# EasyEDA Pro project V3ProPrj_ROV板子_2026-09-12.epro

# Schematic Schematic1
Assembly Variant: Basic; Board Name: Board1; Create Date: 2026-09-11; Page Name: P1; Project Name: ROV板子; Schematic Name: Schematic1; Update Date: 2026-09-11; Company: 嘉立创EDA; Page Size: A4; Version: V1.0
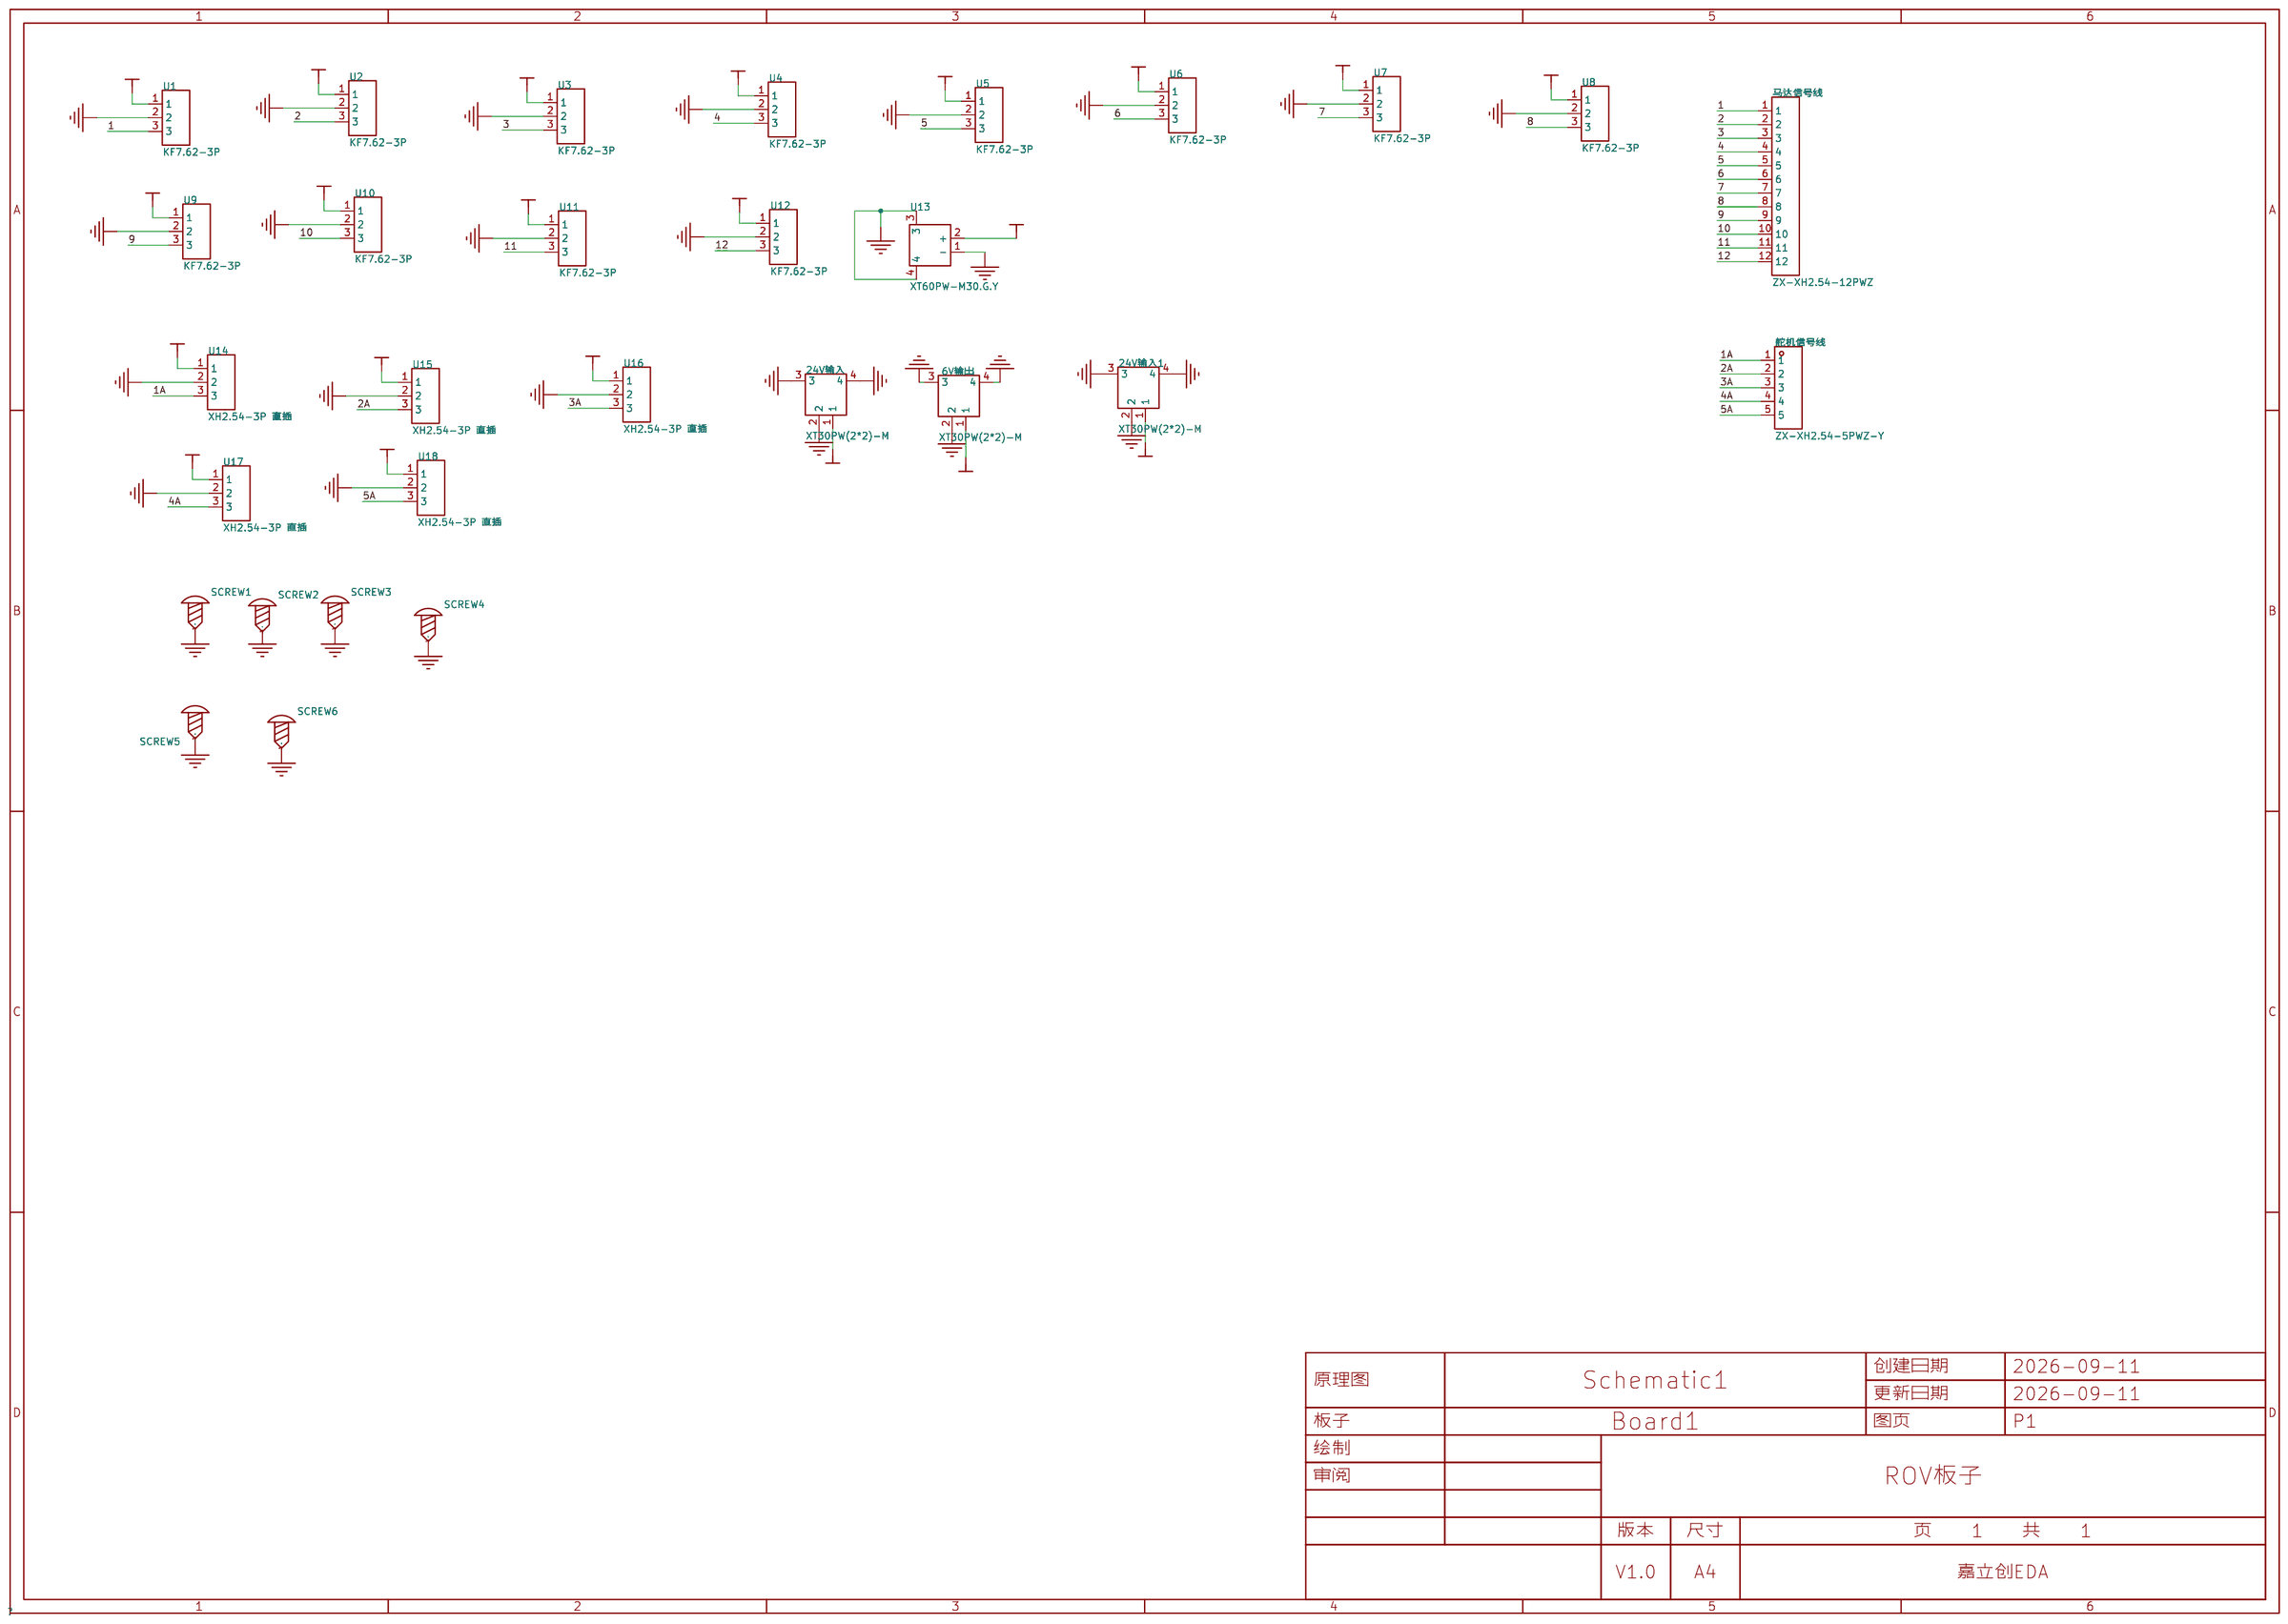
[diagram p0: schematic sheet]

## Parts
6V输出  XT30PW(2*2)-M  [CONN-TH_XT30PW-M]
24V输入  XT30PW(2*2)-M  [CONN-TH_XT30PW-M]
24V输入1  XT30PW(2*2)-M  [CONN-TH_XT30PW-M]
SCREW1  -  [M3螺丝]
SCREW2  -  [M3螺丝]
SCREW3  -  [M3螺丝]
SCREW4  -  [M3螺丝]
SCREW5  -  [M3螺丝]
SCREW6  -  [M3螺丝]
U1  KF7.62-3P  [CONN-TH_KF7.62-3P]
U2  KF7.62-3P  [CONN-TH_KF7.62-3P]
U3  KF7.62-3P  [CONN-TH_KF7.62-3P]
U4  KF7.62-3P  [CONN-TH_KF7.62-3P]
U5  KF7.62-3P  [CONN-TH_KF7.62-3P]
U6  KF7.62-3P  [CONN-TH_KF7.62-3P]
U7  KF7.62-3P  [CONN-TH_KF7.62-3P]
U8  KF7.62-3P  [CONN-TH_KF7.62-3P]
U9  KF7.62-3P  [CONN-TH_KF7.62-3P]
U10  KF7.62-3P  [CONN-TH_KF7.62-3P]
U11  KF7.62-3P  [CONN-TH_KF7.62-3P]
U12  KF7.62-3P  [CONN-TH_KF7.62-3P]
U13  XT60PW-M30.G.Y  [CONN-TH_XT60PW-M]
U14  XH2.54-3P 直插  [CONN-TH_XH2.54-3P]
U15  XH2.54-3P 直插  [CONN-TH_XH2.54-3P]
U16  XH2.54-3P 直插  [CONN-TH_XH2.54-3P]
U17  XH2.54-3P 直插  [CONN-TH_XH2.54-3P]
U18  XH2.54-3P 直插  [CONN-TH_XH2.54-3P]
舵机信号线  ZX-XH2.54-5PWZ-Y  [CONN-TH_5P-P2.50_ZX-XH2.54-5PWZ-Y]
马达信号线  ZX-XH2.54-12PWZ  [CONN-TH_BX-XH2.54-12PWZ]

## Library data of the parts
6V输出 24V输入 24V输入1 = XT30PW(2*2)-M: Supplier Part: C9900097120; JLCPCB Part Class: Extended Part; Supplier: LCSC
SCREW1-SCREW6 = M3螺丝: Supplier Footprint: 插件
U1-U12 = KF7.62-3P_C7277946: 绿色尼龙环保; Supplier Part: C7277946; Manufacturer: KEFA(科发); Supplier Footprint: P=7.62mm; JLCPCB Part Class: Extended Part; Datasheet: https://item.szlcsc.com/datasheet/KF7.62-3P/8247085.html; Supplier: LCSC
U13 = XT60PW-M30.G.Y: Supplier Part: C7204007; Supplier Footprint: 插件; JLCPCB Part Class: Extended Part; Supplier: LCSC
U14-U18 = XH2.54-3P 直插: Supplier Part: C9900000727; Supplier Footprint: TH-3_5.8X10.0X2.54P; JLCPCB Part Class: Extended Part; Supplier: LCSC
舵机信号线 = ZX-XH2.54-5PWZ-Y: 插针结构:1x5P;间距:2.5mm;安装方式:弯插;参考系列:XH;总PIN数:5P;排数:1;每排PIN数:5;行距:-;额定电流:3A;触头材质:铜合金;触头镀层:锡;工作温度:-25℃~+85℃;; LCSC Part Name: 1x5P 间距:2.5mm 弯插 系列:XH; Supplier Part: C22388682; Manufacturer: Megastar(兆星); Supplier Footprint: 弯插,P=2.5mm; JLCPCB Part Class: Extended Part; Datasheet: https://item.szlcsc.com/datasheet/ZX-XH2.54-5PWZ-Y/23957030.html; Supplier: LCSC; Pins Structure: 1x5P; Pitch: 2.5mm; Mounting Type: 弯插; Reference Series: XH; Number of Pins: 5P; Number of Rows: 1; Number of PINs Per Row: 5; Current Rating: 3A; Contact Material: 铜合金; Contact Plating: 锡; Operating Temperature: -25℃~+85℃; Voltage Rating: 250V; Plastic Material: PA66; Color: 黄色; Z-Height of the Board: 5.75mm; X-Length of Bottom Edge on Board (Spacing Line): 15mm; Y-Width of Bottom Edge on Board: 7.17mm
马达信号线 = ZX-XH2.54-12PWZ: 插针结构:1x12P;间距:2.5mm;安装方式:弯插;参考系列:XH;总PIN数:12P;排数:1;每排PIN数:12;行距:-;额定电流:3A;触头材质:黄铜;触头镀层:锡;工作温度:-25℃~+85℃;; LCSC Part Name: 1x12P 间距:2.5mm 弯插 系列:XH; Supplier Part: C22366173; Manufacturer: Megastar(兆星); Supplier Footprint: 弯插,P=2.5mm; JLCPCB Part Class: Extended Part; Datasheet: https://item.szlcsc.com/datasheet/ZX-XH2.54-12PWZ/23836761.html; Supplier: LCSC; Pins Structure: 1x12P; Pitch: 2.5mm; Mounting Type: 弯插; Reference Series: XH; Number of Pins: 12P; Number of Rows: 1; Number of PINs Per Row: 12; Current Rating: 3A; Contact Material: 黄铜; Contact Plating: 锡; Operating Temperature: -25℃~+85℃; Voltage Rating: 250V; Plastic Material: PA66; Flame Retardant Rating: UL94V-0; Color: 白色; Z-Height of the Board: 5.9mm; X-Length of Bottom Edge on Board (Spacing Line): 32.5mm; Y-Width of Bottom Edge on Board: 7.32mm

## Nets
24V: 24V输入.1 24V输入1.1 U1.1 U2.1 U3.1 U4.1 U5.1 U6.1 U7.1 U8.1 U9.1 U10.1 U11.1 U12.1 U13.2(+)
+6V: 6V输出.1 U14.1 U15.1 U16.1 U17.1 U18.1
GND: 6V输出.2 6V输出.3 6V输出.4 24V输入.2 24V输入.3 24V输入.4 24V输入1.2 24V输入1.3 24V输入1.4 SCREW1.1 SCREW2.1 SCREW3.1 SCREW4.1 SCREW5.1 SCREW6.1 U1.2 U2.2 U3.2 U4.2 U5.2 U6.2 U7.2 U8.2 U9.2 U10.2 U11.2 U12.2 U13.1(-) U13.3 U13.4 U14.2 U15.2 U16.2 U17.2 U18.2
1: U1.3 马达信号线.1
1A: U14.3 舵机信号线.1
2: U2.3 马达信号线.2
2A: U15.3 舵机信号线.2
3: U3.3 马达信号线.3
3A: U16.3 舵机信号线.3
4: U4.3 马达信号线.4
4A: U17.3 舵机信号线.4
5: U5.3 马达信号线.5
5A: U18.3 舵机信号线.5
6: U6.3 马达信号线.6
7: U7.3 马达信号线.7
8: U8.3 马达信号线.8
9: U9.3 马达信号线.9
10: U10.3 马达信号线.10
11: U11.3 马达信号线.11
12: U12.3 马达信号线.12

# Board PCB1
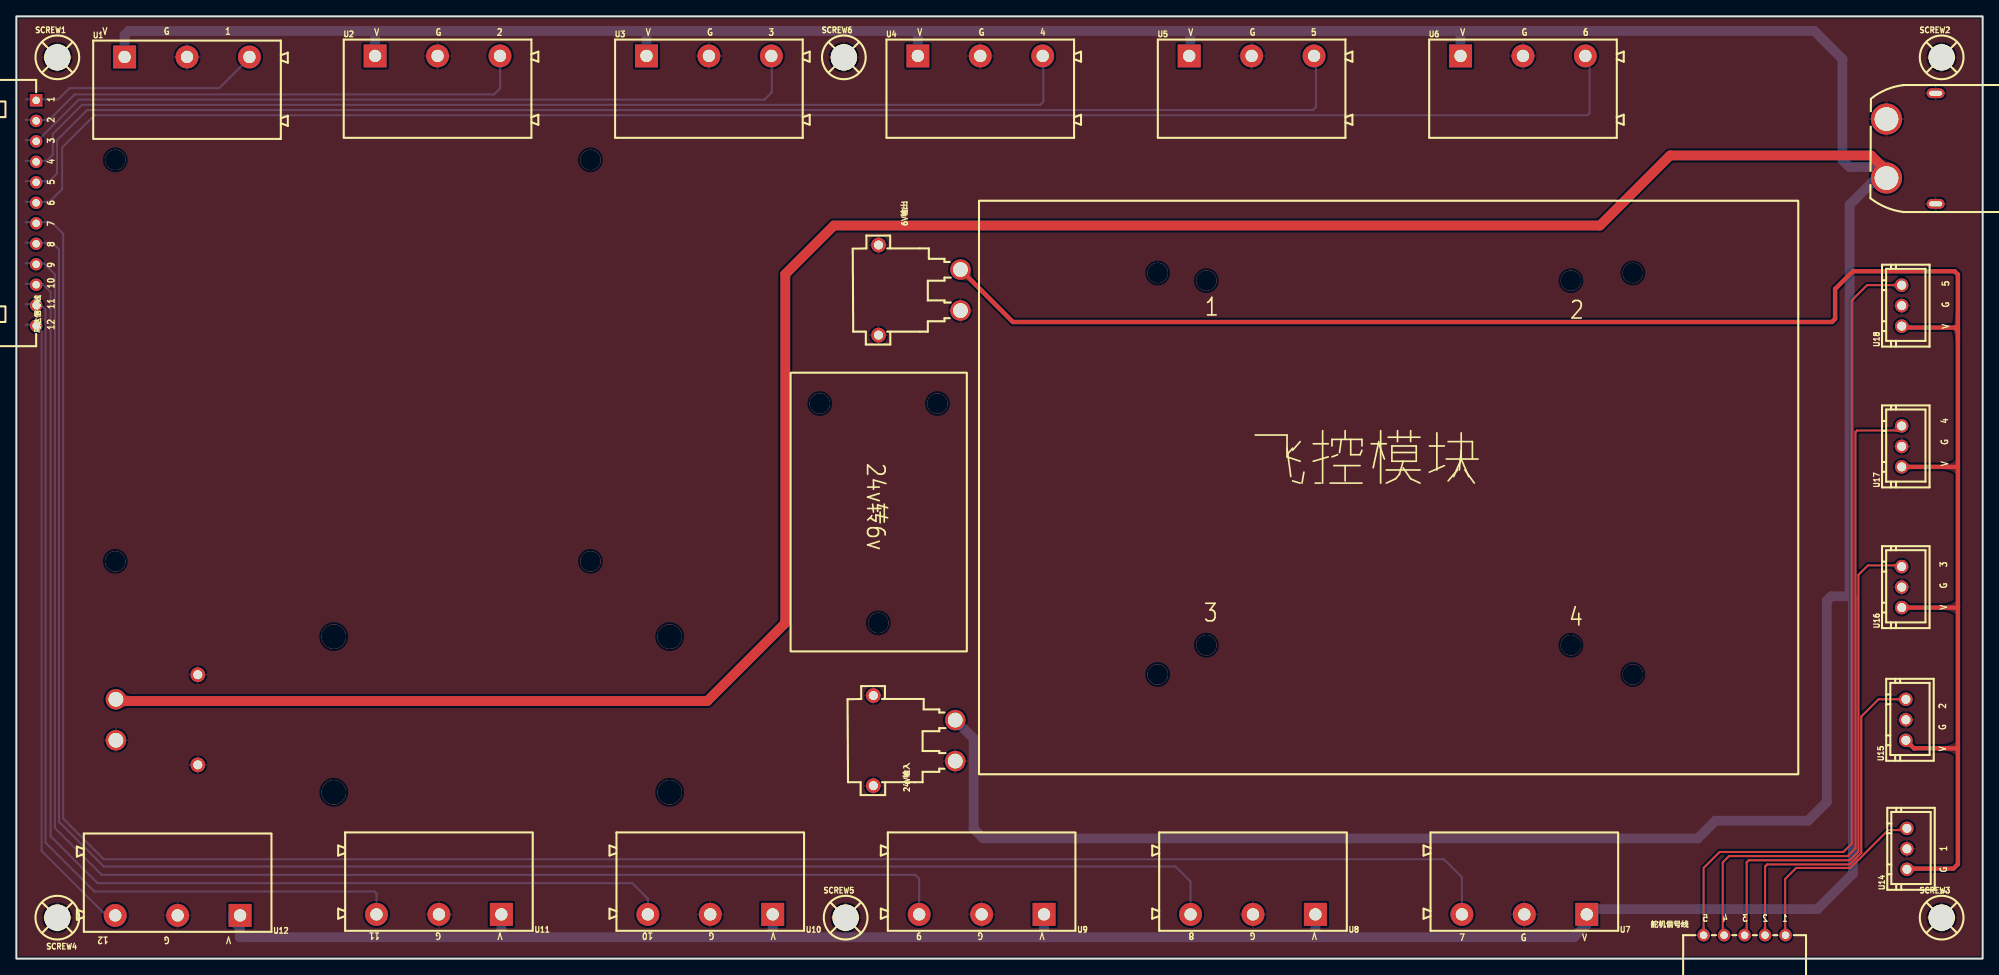
[diagram p1: board, top side]
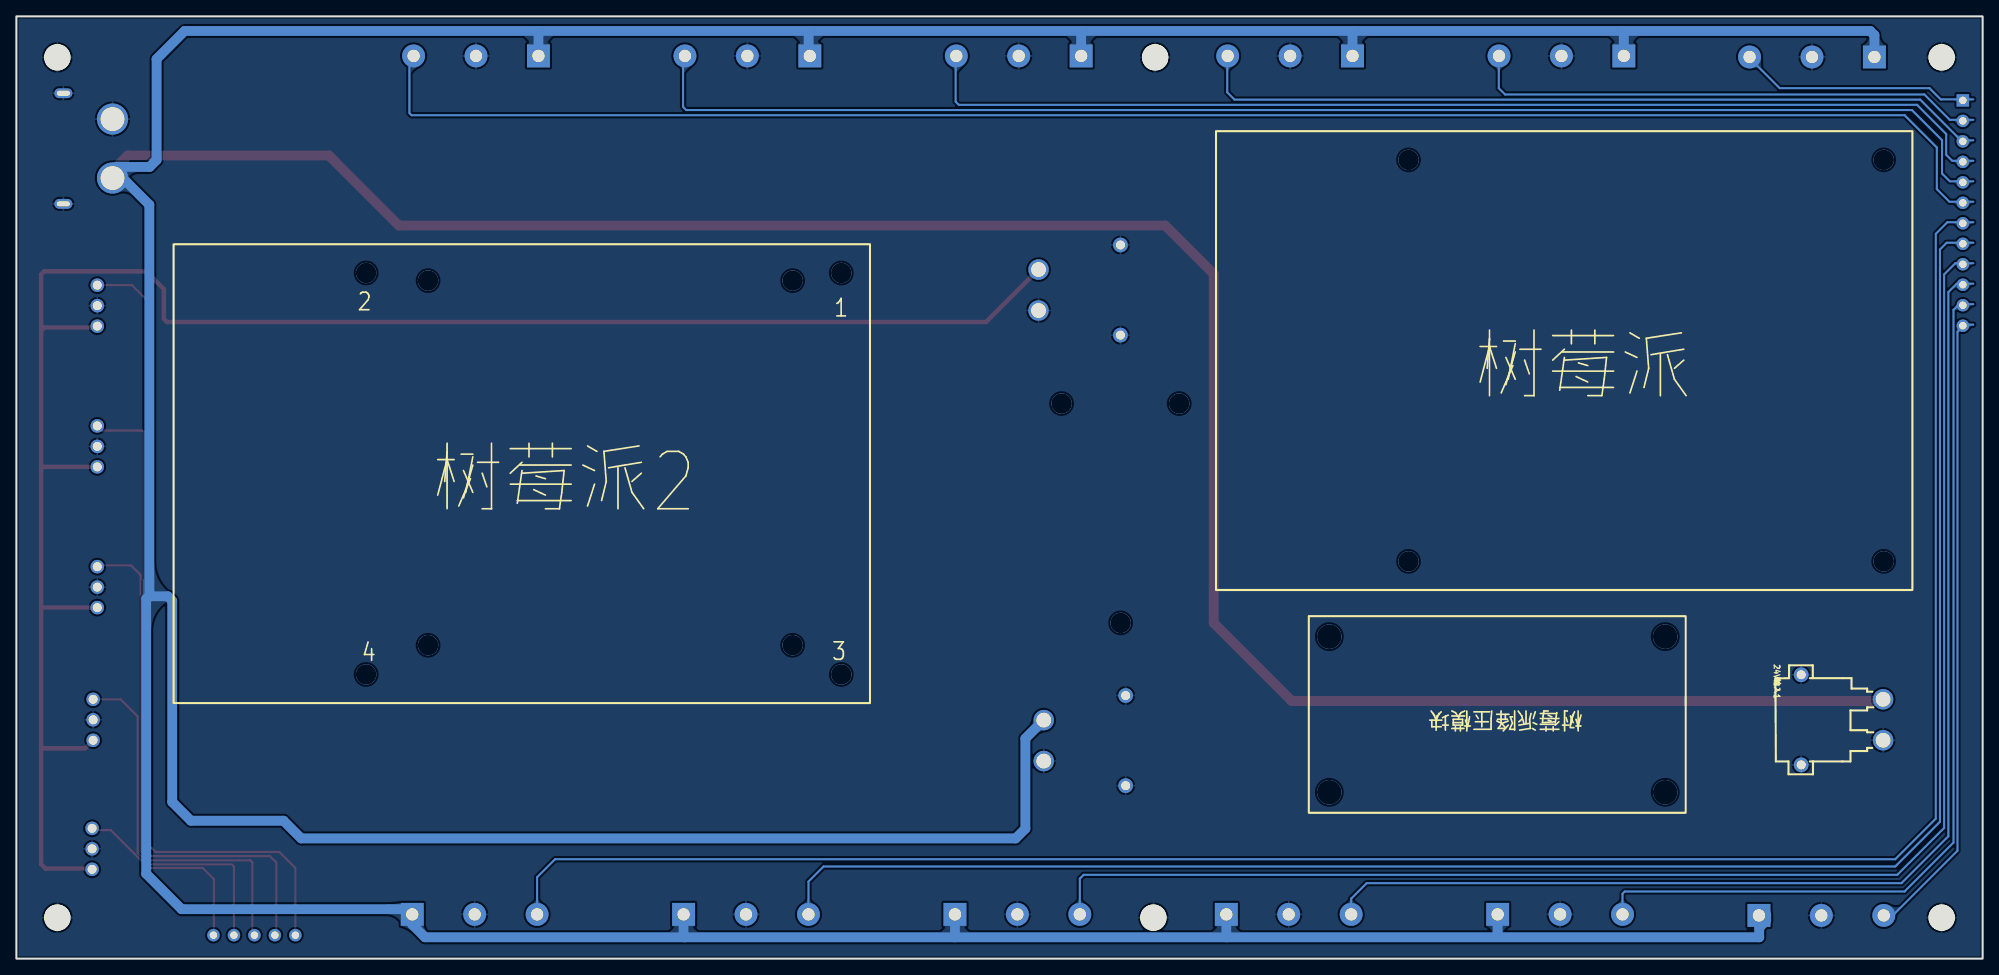
[diagram p2: board, bottom side, seen from below]

Outline 240 x 115 mm; copper layers: Top Layer, Bottom Layer. Coordinates in mm from the lower left corner of the outline.
Outline path: rectangle 0,115 240,0
Stack: Top Layer 0.035mm / Dielectric1 1.51mm FR4 er 4.5 / Bottom Layer 0.035mm

## Design rules (mm)
spacing copperThickness1oz (default): track to track 0.102, other pairs 0.152 to 0.3
spacing copperThickness2oz: track to track 0.203, other pairs 0.152 to 0.3
track width copperThickness1oz (default): min 0.127, default 0.254, max 2.54
track width copperThickness2oz: min 0.203, default 0.254, max 2.54
differential pair differentialPair (default): width min 0.127, default 0.254, max 2.54; gap min 0.152, default 0.152
net GND uses copperRegion

## Placement (name value [footprint] x y rotation side)
6V输出  XT30PW(2*2)-M  [CONN-TH_XT30PW-M]  110.24 81.6 270 top
24V输入  XT30PW(2*2)-M  [CONN-TH_XT30PW-M]  109.6 26.61 270 top
24V输入1  XT30PW(2*2)-M  [CONN-TH_XT30PW-M]  17.15 29.15 270 bottom
SCREW1  -  [M3螺丝]  5 110 0 top
SCREW2  -  [M3螺丝]  235 110 0 top
SCREW3  -  [M3螺丝]  235 5 0 top
SCREW4  -  [M3螺丝]  5 5 0 top
SCREW5  -  [M3螺丝]  101.22 5 0 top
SCREW6  -  [M3螺丝]  101 110 0 top
U1  KF7.62-3P  [CONN-TH_KF7.62-3P]  20.83 110.05 0 top
U2  KF7.62-3P  [CONN-TH_KF7.62-3P]  51.41 110.17 0 top
U3  KF7.62-3P  [CONN-TH_KF7.62-3P]  84.53 110.17 0 top
U4  KF7.62-3P  [CONN-TH_KF7.62-3P]  117.65 110.17 0 top
U5  KF7.62-3P  [CONN-TH_KF7.62-3P]  150.77 110.17 0 top
U6  KF7.62-3P  [CONN-TH_KF7.62-3P]  183.9 110.17 0 top
U7  KF7.62-3P  [CONN-TH_KF7.62-3P]  184.06 5.4 180 top
U8  KF7.62-3P  [CONN-TH_KF7.62-3P]  150.94 5.4 180 top
U9  KF7.62-3P  [CONN-TH_KF7.62-3P]  117.82 5.4 180 top
U10  KF7.62-3P  [CONN-TH_KF7.62-3P]  84.7 5.4 180 top
U11  KF7.62-3P  [CONN-TH_KF7.62-3P]  51.58 5.4 180 top
U12  KF7.62-3P  [CONN-TH_KF7.62-3P]  19.69 5.27 180 top
U13  XT60PW-M30.G.Y  [CONN-TH_XT60PW-M]  231.27 98.87 180 top
U14  XH2.54-3P 直插  [CONN-TH_XH2.54-3P]  230.76 13.4 90 top
U15  XH2.54-3P 直插  [CONN-TH_XH2.54-3P]  230.63 29.15 90 top
U16  XH2.54-3P 直插  [CONN-TH_XH2.54-3P]  230.12 45.34 90 top
U17  XH2.54-3P 直插  [CONN-TH_XH2.54-3P]  230.12 62.52 90 top
U18  XH2.54-3P 直插  [CONN-TH_XH2.54-3P]  230.12 79.69 90 top
舵机信号线  ZX-XH2.54-5PWZ-Y  [CONN-TH_5P-P2.50_ZX-XH2.54-5PWZ-Y]  210.95 2.86 0 top
马达信号线  ZX-XH2.54-12PWZ  [CONN-TH_BX-XH2.54-12PWZ]  2.41 91 270 top

## Footprints (pads in the part's own frame, mm; a bottom-side part is the same pattern mirrored in y, then rotated)
CONN-TH_5P-P2.50_ZX-XH2.54-5PWZ-Y
  round 1.524 hole 0.914: 1(5,0) 2(2.5,0) 3(0,0) 4(-2.5,0) 5(-5,0)
CONN-TH_BX-XH2.54-12PWZ
  rect 1.524x1.524 hole 0.914: 1(-13.751,0)
  round 1.524 hole 0.914: 2(-11.25,0) 3(-8.751,0) 4(-6.25,0) 5(-3.75,0) 6(-1.25,0) 7(1.25,0) 8(3.75,0) 9(6.25,0) 10(8.75,0) 11(11.25,0) 12(13.751,0)
CONN-TH_KF7.62-3P
  rect 2.8x2.8 hole 1.5: 1(-7.62,0)
  round 2.8 hole 1.5: 2(0,0) 3(7.62,0)
CONN-TH_XH2.54-3P
  round 1.65 hole 1.1: 1(-2.5,0) 2(0,0) 3(2.5,0)
CONN-TH_XT30PW-M
  round 2.5 hole 1.8: 1(-2.5,5) 2(2.5,5)
  round 1.8 hole 1.1: 3(5.5,-5) 4(-5.5,-5)
CONN-TH_XT60PW-M
  round 3.8 hole 2.9: 1(3,-3.6) 2(3,3.6)
  oval 2.2x1.2 hole 1.6x0.6: 3(-3,6.75) 4(-3,-6.75)
M3螺丝
  round 3.2 hole 3.2: 1(0,0)

## Nets
As in the schematic.

## Via types
v1: diameter 2.5, hole 2.5, Top Layer to Bottom Layer, 15 vias
v2: diameter 3, hole 3, Top Layer to Bottom Layer, 4 vias

## Routing (per net, layer and track width the routed paths; a pad name or vN(x,y) marks a point on that pad's centre or on a via; arc(x,y) is an arc through that point)
24V: length 970.9
  Top Layer w1.2: 228.65,95.78 226.4,98.03 201.85,98.03 193.29,89.47 99.78,89.47 93.85,83.54 93.85,40.96 84.33,31.43 12.36,31.43 24V输入1.1
  Bottom Layer w1.2: 143.3,113.22 176.31,113.22 ; 143.3,113.22 143.3,110.32 U5.1 ; 143.3,113.22 110.12,113.22 ; 176.31,113.22 176.28,113.18 U6.1 ; 176.31,113.22 219.46,113.22 222.88,109.79 222.88,97.47 223.73,96.63 227.8,96.63 228.65,95.78 227.54,95.78 223.77,92.01 223.77,44.3 ; 110.12,113.22 110.03,113.14 U4.1 ; 110.12,113.22 76.88,113.22 ; 76.88,113.22 76.91,113.19 U3.1 ; 76.88,113.22 43.8,113.22 ; U2.1 43.8,110.18 43.8,113.22 ; 92.24,2.6 27.26,2.6 27.26,3.79 26.42,4.64 26.42,5.4 ; 92.24,2.6 92.32,2.68 U10.1 ; 92.24,2.6 158.43,2.6 ; 27.3,5.4 26.42,5.4 ; 24V输入.1 116.84,26.87 116.84,15.86 118.03,14.67 205.23,14.67 207.39,16.83 218.69,16.83 220.98,19.12 220.98,43.67 221.53,44.22 223.69,44.22 223.77,44.3 ; 158.43,2.6 190.12,2.6 191.68,4.17 U7.1 192.32,6.03 219.84,6.03 224.16,10.35 224.16,43.92 223.77,44.3 ; 158.43,2.6 158.56,2.74 U8.1 ; 13.21,109.67 13.21,112.71 13.72,113.22 43.8,113.22 ; U11.1 59.19,2.86 ; U9.1 125.44,2.61
+6V: length 235.3
  Top Layer w0.54: 236.98,25.72 236.93,25.66 231.62,25.66 U15.1 ; 236.98,25.72 236.98,11.53 236.44,10.99 230.85,10.99 U14.1 ; 236.98,25.72 236.98,42.86 ; 6V输出.1 121.63,77.7 221.62,77.7 222,78.08 222,81.73 224.16,83.89 236.6,83.89 236.98,83.5 236.98,76.64 ; U18.1 230.29,77.03 236.6,77.03 236.98,76.64 ; 236.98,76.64 236.98,60.12 ; 236.98,60.12 236.98,42.86 ; 236.98,60.12 236.88,60.02 230.12,60.02 ; 236.98,42.86 236.96,42.84 U16.1
(no net):
  vias: v1(12.07,97.48) v1(12.07,48.48) v1(70.07,97.48) v1(70.07,48.48) v1(98.06,67.74) v1(105.21,40.97) v1(112.42,67.74) v1(139.31,83.68) v1(139.31,34.68) v1(145.25,82.75) v1(145.25,38.25) v1(189.75,82.75) v1(189.75,38.25) v1(197.31,83.68) v1(197.31,34.68) v2(38.74,39.3) v2(38.74,20.3) v2(79.74,39.3) v2(79.74,20.3)
1: length 30.1
  Bottom Layer w0.254: 1.14,104.87 5.11,104.87 6.48,106.24 24.77,106.24 28.19,109.67 29.21,109.67
1A: length 24.3
  Top Layer w0.254: 舵机信号线.1 215.9,2.91 215.9,9.72 217.24,11.06 223.85,11.06 228.47,15.69 230.55,15.69 U14.3
2: length 63.5
  Bottom Layer w0.254: 1.14,102.37 4.01,102.37 7.11,105.47 58.29,105.47 59.06,106.24 59.06,110.15 U2.3
2A: length 43.8
  Top Layer w0.254: 舵机信号线.2 213.45,11.24 213.7,11.5 223.78,11.5 225.2,12.91 225.2,29.55 227.29,31.65 U15.3
3: length 98
  Bottom Layer w0.254: U3.3 92.2,110.12 92.2,105.73 91.31,104.84 7.62,104.84 2.65,99.87 1.14,99.87
3A: length 62.8
  Top Layer w0.254: U16.3 229.97,48 226.01,48 224.84,46.83 224.84,13.07 223.77,12 211.46,12 211.2,11.75 211.2,3.11 舵机信号线.3
4: length 134.3
  Bottom Layer w0.254: U4.3 125.35,110.1 125.35,104.59 124.97,104.2 8,104.2 4.45,100.65 4.45,98.11 3.71,97.37 1.14,97.37
4A: length 82.6
  Top Layer w0.254: 舵机信号线.4 208.28,3.03 208.28,11.75 209.04,12.51 223.52,12.51 224.48,13.47 224.48,64.27 224.66,64.45 229.56,64.45 U17.3
5: length 169.9
  Bottom Layer w0.254: 1.14,94.87 4,94.87 4.95,95.82 4.95,99.89 8.64,103.57 158.24,103.57 158.62,103.95 158.62,109.95 U5.3
5A: length 100.7
  Top Layer w0.254: 舵机信号线.5 205.95,11.07 207.9,13.02 223.01,13.02 224.03,14.03 224.03,80.33 225.89,82.19 U18.3
6: length 205.7
  Bottom Layer w0.254: 1.14,92.37 4.04,92.37 5.59,93.92 5.59,99 9.52,102.94 191.77,102.94 192.02,103.19 192.02,109.92 191.77,110.17 U6.3
7: length 254.8
  Bottom Layer w0.254: 1.14,89.87 4.3,89.87 5.72,88.46 5.72,17.08 10.67,12.13 174.24,12.13 176.44,9.93 U7.3
8: length 219.4
  Bottom Layer w0.254: 1.14,87.37 4.38,87.37 5.21,86.55 5.21,16.7 10.67,11.24 141.48,11.24 143.32,9.4 U8.3
9: length 184.1
  Bottom Layer w0.254: 1.14,84.87 3.33,84.87 4.7,83.5 4.7,15.94 10.41,10.22 109.73,10.22 110.2,9.75 U9.3
10: length 147.9
  Bottom Layer w0.254: U10.3 77.08,7.32 75.18,9.21 9.91,9.21 4.18,14.94 4.18,81.36 3.16,82.37 1.14,82.37
11: length 113.2
  Bottom Layer w0.254: U11.3 43.95,7.93 43.69,8.19 9.52,8.19 3.56,14.16 3.56,79.19 2.87,79.87 1.14,79.87
12: length 76.6
  Bottom Layer w0.254: 10.83,5.4 3.07,13.16 3.07,76.49 2.19,77.37 1.14,77.37

## Copper pours and planes (outline as drawn; the poured copper is in the pictures)
GND on Top Layer: 0,115 240,115 240,0 0,0
GND on Bottom Layer: 0,115 240,115 240,0 0,0

Small or netless copper shapes (teardrops, artwork), in the pictures only: 22 on Top Layer, 60 on Bottom Layer

## Text on the board
Bottom Silkscreen Layer: 1 | 3 | 4 | 2 | 树莓派降压模块 | 树莓派 | 树莓派2
Top Silkscreen Layer: V | G | 1 | 2 | 3 | 4 | 5 | 7 | 6 | 8 | 9 | 10 | 11 | 12 | 24v转6v | 飞控模块
